# Altium project Relay-Switching-Board-v2.0.PrjPcb (part 2 of 4)
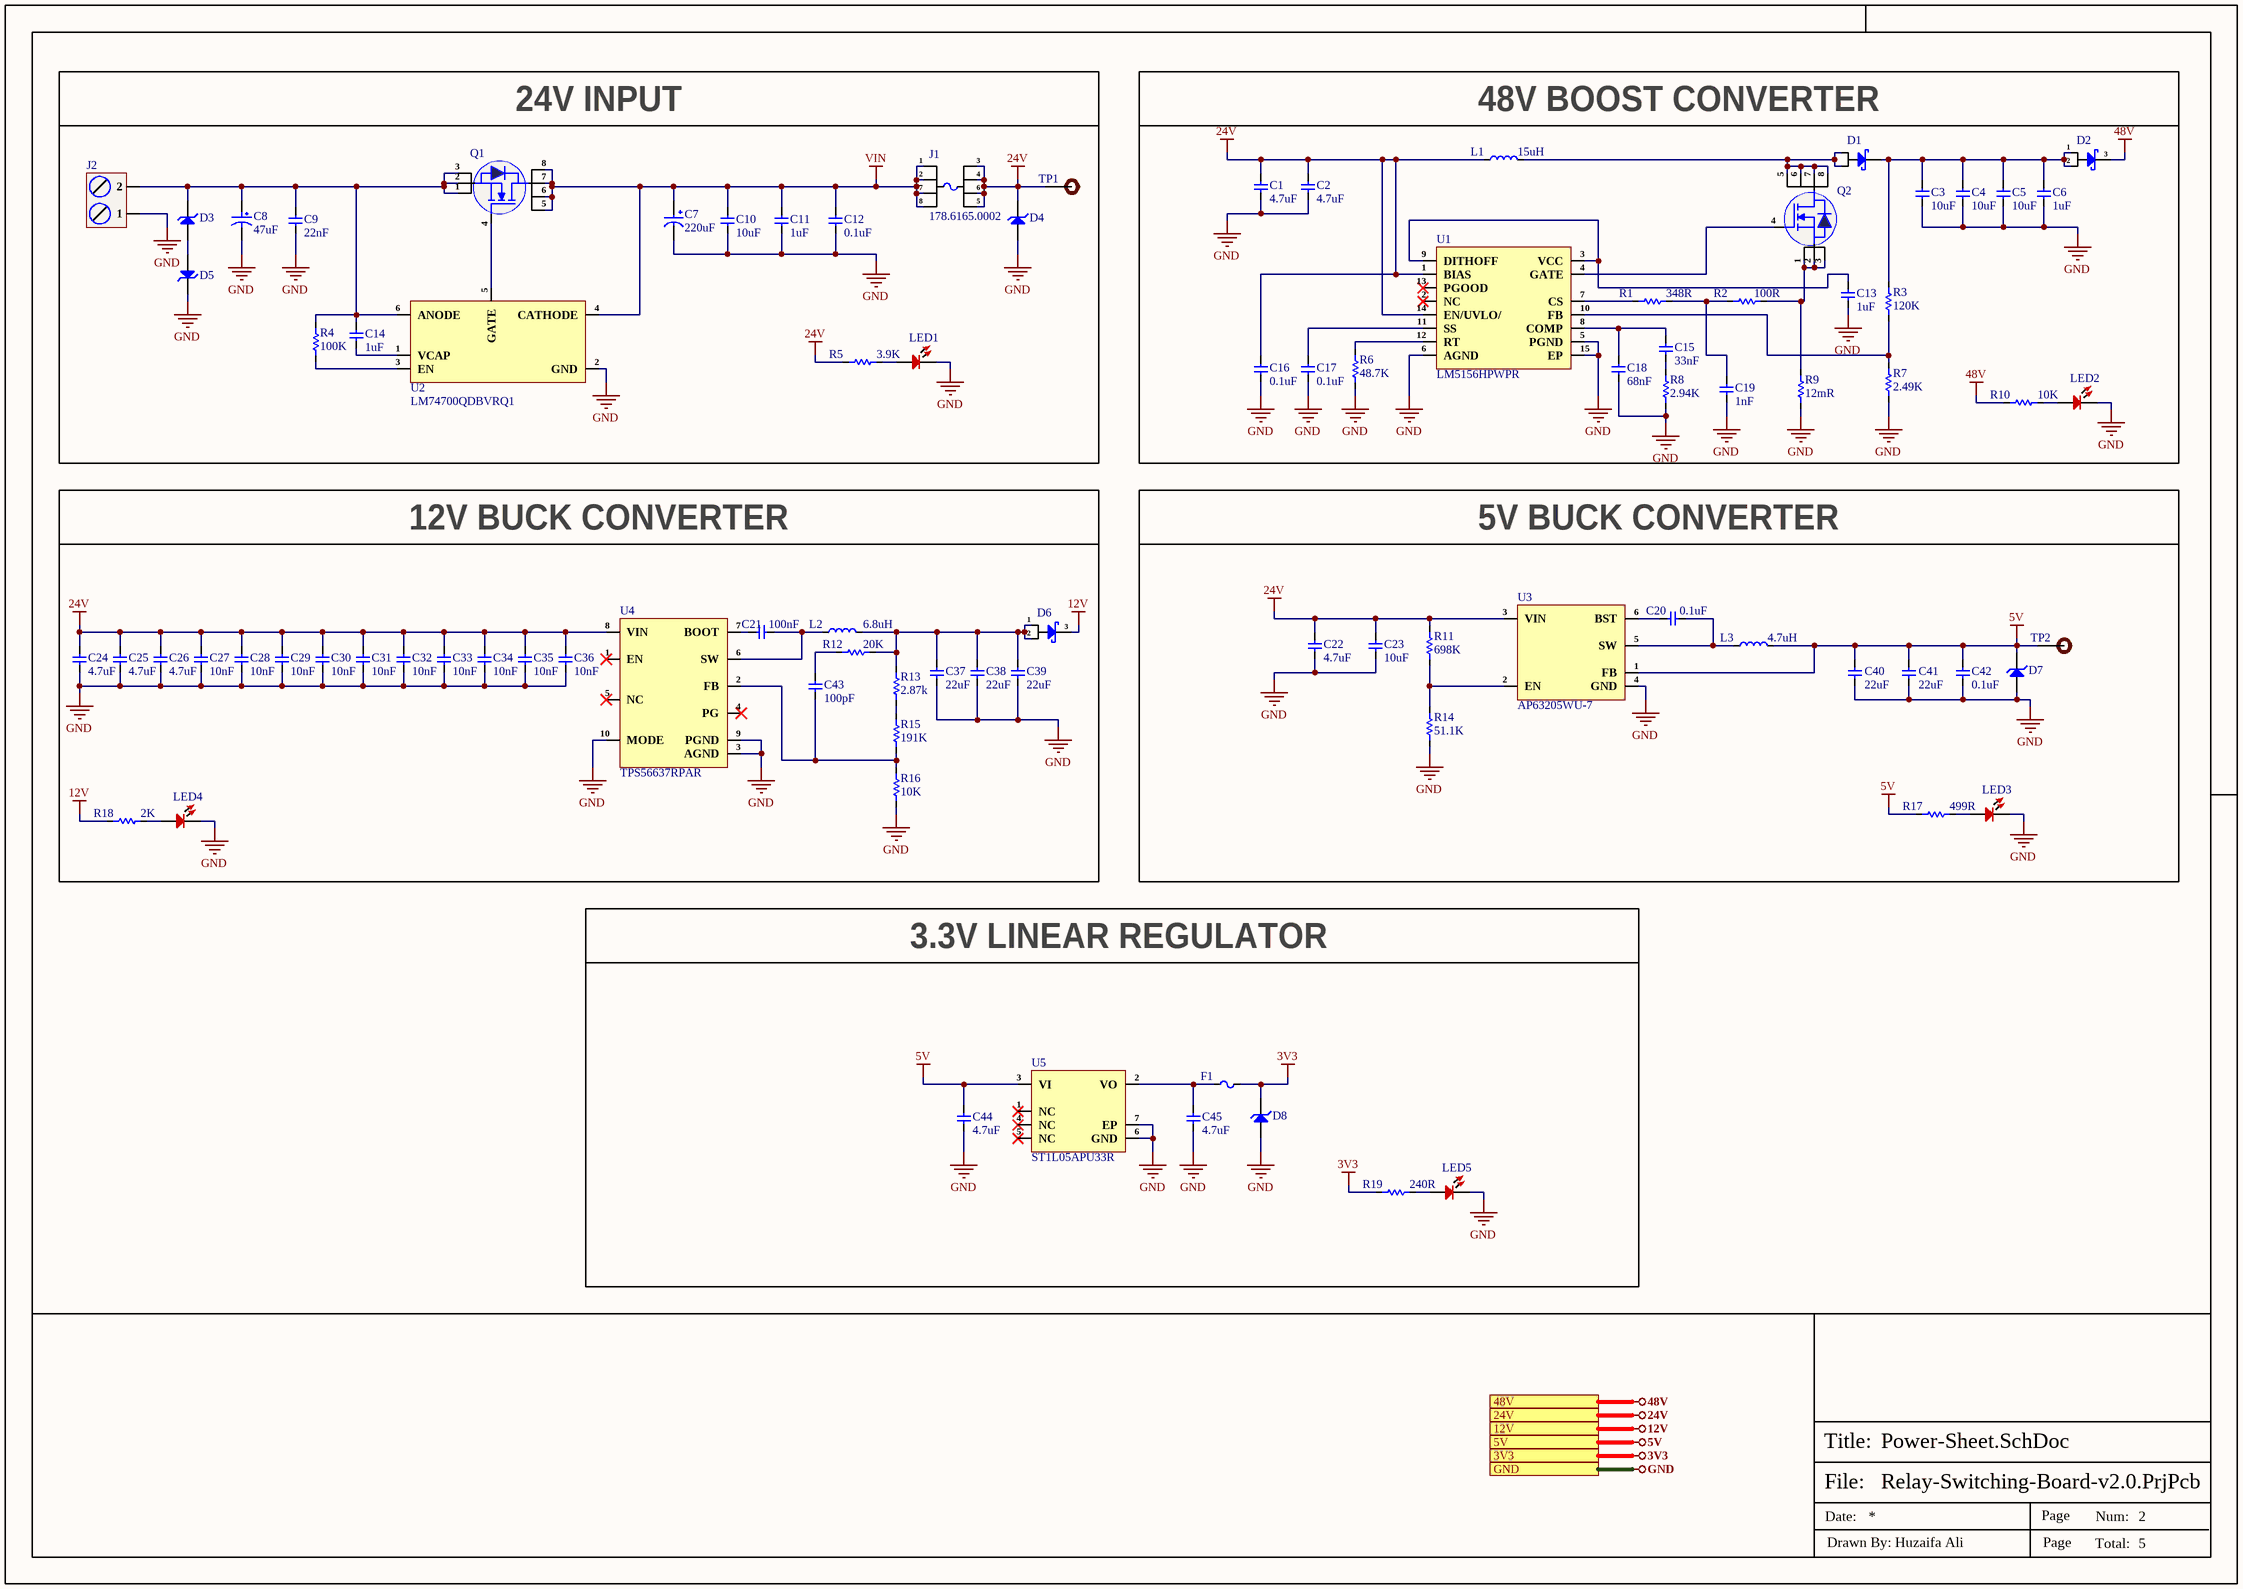
[diagram p5: Power-Sheet.SchDoc]

## Sheet Power-Sheet.SchDoc (continued)
### Library data of the parts
C1 C2 C22 C24-C26 C44 C45 = UMK316AB7475KL-T: CAP CER 4.7UF 50V X7R 1206; Manufacturer: Taiyo Yuden; Item Type: Capacitor; Tolerance: 10%; Supplier: Digikey; LCSC Part Number: C92853; Manufacturer Part Number: UMK316AB7475KL-T; RoHS: Yes; Stock: 392550; Pricing: 1=0.3, 10=0.198, 50=0.146, 100=0.1189, 500=0.09386, 1000=0.07925 (USD); Mounting Technology: Surface Mount; Case/Package: 1206; Pins: 2; Case Code (Metric): 3216; Case Code (Imperial): 1206; Min Operating Temperature: -55°C; Max Operating Temperature: 125°C; Value: 4.7uF; Voltage Rating: 50V; Packaging: Tape and Reel; Package Quantity: 2000; Voltage Rating (DC): 50V; Dielectric: X7R; Termination: SMD/SMT; Series: M; Construction: Flat; Length: 3.2mm; Width: 1.6mm; Height: 1.6mm; Depth: 1.6mm; Radiation Hardening: No; RoHS Compliant: Yes; Reach SVHC Compliant: Unknown; ComponentLink1URL: https://datasheet.ciiva.com/170/umk316ab7475kl-t-ss-170928.pdf?src-supplier=Digikey; ComponentLink1Description: https://datasheet.ciiva.com/170/umk316ab7475kl-t-ss-170928.pdf?src-supplier=Digikey; ComponentLink2URL: https://datasheet.ciiva.com/2990/umk316ab7475kl-t-ss-2990070.pdf?src-supplier=Avnet; ComponentLink2Description: https://datasheet.ciiva.com/2990/umk316ab7475kl-t-ss-2990070.pdf?src-supplier=Avnet; ComponentLink3URL: https://datasheet.ciiva.com/15922/1010umk316ab7475kl-t-15922628.pdf?src-supplier=Onlinecomponents.com; ComponentLink3Description: https://datasheet.ciiva.com/15922/1010umk316ab7475kl-t-15922628.pdf?src-supplier=Onlinecomponents.com; ComponentLink4URL: https://datasheet.ciiva.com/7975/1481447-7975911.pdf?src-supplier=Element14; ComponentLink4Description: https://datasheet.ciiva.com/7975/1481447-7975911.pdf?src-supplier=Element14; ComponentLink5URL: https://datasheet.ciiva.com/5413/mlcc-all-e-541559-5413006.pdf?src-supplier=Mouser; ComponentLink5Description: https://datasheet.ciiva.com/5413/mlcc-all-e-541559-5413006.pdf?src-supplier=Mouser
C3-C5 = FS32X106K101EGG: 100V 10uF X7R ±10% 1210 Multilayer Ceramic Capacitors MLCC - SMD/SMT ROHS; Manufacturer: PSA(Prosperity Dielectrics); Manufacturer Part Number: FS32X106K101EGG; Package: 1210; LCSC Part Number: C5156756; Item Type: Capacitor; ComponentLink1Description: LCSC; ComponentLink1URL: https://www.lcsc.com/product-detail/Multilayer-Ceramic-Capacitors-MLCC-SMD-SMT_PSA-Prosperity-Dielectrics-FS32X106K101EGG_C5156756.html
C6 = GRM31CR72A105KA01K: CAP CER 1UF 100V X7R 1206; Manufacturer: Murata; Tolerance: 10%; Supplier 1: Digi-Key; Manufacturer Part Number: GRM31CR72A105KA01K; RoHS: Yes; Category: Ceramic Capacitors; Stock 1: 11842; Pricing 1: 1=0.48000, 10=0.33000, 50=0.23100, 100=0.19800, 500=0.14850, 1000=0.12540, 2500=0.11880 (USD); Mount: Surface Mount; Case/Package: 1206; Case Code (Imperial): 1206; Case Code (Metric): 3216; Min Operating Temperature: -55°C; Max Operating Temperature: 125°C; Capacitance: 1uF; Voltage Rating: 100V; Voltage Rating (DC): 100V; Packaging: Tape and Reel; Package Quantity: 1; Dielectric: X7R; Termination: SMD/SMT; Series: GRM; Construction: Flat; Length: 3.2mm; Width: 1.6mm; Height: 1.6mm; Thickness: 0.071inch; Depth: 1.6mm; Radiation Hardening: No; RoHS Compliant: Yes; ComponentLink1URL: https://datasheet.ciiva.com/11616/product-11616604.pdf?src-supplier=Avnet; ComponentLink1Description: https://datasheet.ciiva.com/11616/product-11616604.pdf?src-supplier=Avnet; ComponentLink2URL: https://datasheet.ciiva.com/6264/partnumbering-e-01-6264397.pdf?src-supplier=Digi-Key; ComponentLink2Description: https://datasheet.ciiva.com/6264/partnumbering-e-01-6264397.pdf?src-supplier=Digi-Key; ComponentLink3URL: https://datasheet.ciiva.com/6264/partnumbering-e-01-6264398.pdf?src-supplier=Digi-Key; ComponentLink3Description: https://datasheet.ciiva.com/6264/partnumbering-e-01-6264398.pdf?src-supplier=Digi-Key; ComponentLink4URL: https://datasheet.ciiva.com/6264/partnumbering-e-01-6264399.pdf?src-supplier=Digi-Key; ComponentLink4Description: https://datasheet.ciiva.com/6264/partnumbering-e-01-6264399.pdf?src-supplier=Digi-Key; Supplier Part Number 1: 490-6523-1-ND; LCSC Part Number: C909823
C7 = UCD1H221MNL1GS: CAP ALUM 220UF 20% 50V SMD; Manufacturer: Nichicon; Ripple Current: 700mA; Impedance: 160mR; Leakage Current: 3uA; Life (Hours): 5000Hour; Dissipation Factor: 0.1%; Item Type: Capacitor; Supplier 1: Digi-Key; Manufacturer Part Number: UCD1H221MNL1GS; RoHS: Yes; Category: Aluminum Electrolytic Capacitors; Pricing 1: 1=0.85000, 10=0.60200, 50=0.45480, 100=0.39620 (USD); Mount: Surface Mount,PCB; Case/Package: Radial; Min Operating Temperature: -55°C; Max Operating Temperature: 105°C; Capacitance: 220uF; Tolerance: 20%; Voltage Rating: 50V; Packaging: Tape and Reel; Package Quantity: 1; Voltage Rating (DC): 50V; Termination: SMD/SMT; Voltage: 50V; Features: General Purpose; Series: CD; Construction: Cylindrical; Diameter: 10mm; Length: 10mm; Height: 10mm; Height - Seated (Max): 0.394inch; Radiation Hardening: No; Lead Free: Lead Free; RoHS Compliant: Yes; ComponentLink1URL: https://datasheet.ciiva.com/11776/0900766b80ebdadd-11776792.pdf?src-supplier=RSComponents; ComponentLink1Description: https://datasheet.ciiva.com/11776/0900766b80ebdadd-11776792.pdf?src-supplier=RSComponents; ComponentLink2URL: https://datasheet.ciiva.com/5362/e-cd-22158-5362489.pdf?src-supplier=Mouser; ComponentLink2Description: https://datasheet.ciiva.com/5362/e-cd-22158-5362489.pdf?src-supplier=Mouser; ComponentLink3URL: https://datasheet.ciiva.com/11684/e-cd-11684678.pdf?src-supplier=Avnet; ComponentLink3Description: https://datasheet.ciiva.com/11684/e-cd-11684678.pdf?src-supplier=Avnet; ComponentLink4URL: https://datasheet.ciiva.com/15037/e-cd-15037119.pdf?src-supplier=Digi-Key; ComponentLink4Description: https://datasheet.ciiva.com/15037/e-cd-15037119.pdf?src-supplier=Digi-Key; ComponentLink5URL: https://datasheet.ciiva.com/16393/e-cd-16393493.pdf?src-supplier=Future+Electronics; ComponentLink5Description: https://datasheet.ciiva.com/16393/e-cd-16393493.pdf?src-supplier=Future+Electronics; ComponentLink6URL: https://datasheet.ciiva.com/17354/e-cd-17354606.pdf?src-supplier=Avnet+Europe; ComponentLink6Description: https://datasheet.ciiva.com/17354/e-cd-17354606.pdf?src-supplier=Avnet+Europe; Supplier Part Number 1: 493-6390-1-ND; LCSC Part Number: C116211
C8 = RVT1H470M0607: 47uF 50V 66mA@120Hz ±20% SMD,D6.3xL7.7mm Aluminum Electrolytic Capacitors - SMD ROHS; Manufacturer: ROQANG; Manufacturer Part Number: RVT1H470M0607; Package: SMD,D6.3xL7.7mm; LCSC Part Number: C72523; Item Type: Capacitor; ComponentLink1Description: LCSC; ComponentLink1URL: https://www.lcsc.com/product-detail/Aluminum-Electrolytic-Capacitors-SMD_ROQANG-RVT1H470M0607_C72523.html
C9 = CC0805JRX7R0BB223: CAP CER 0.022UF 100V X7R 0805; Manufacturer: Yageo; Item Type: Capacitors; Tolerance: 5%; Supplier: Digikey; LCSC Part Number: C576993; Manufacturer Part Number: CC0805JRX7R0BB223; RoHS: Yes; Stock: 2257; Pricing: 1=0.13, 10=0.07, 50=0.0488, 100=0.0421, 500=0.03086, 1000=0.02736 (USD); Mounting Technology: Surface Mount; Case/Package: 0805; Min Operating Temperature: -55°C; Max Operating Temperature: 125°C; Value: 22nF; Dielectric: X7R; Construction: Flat; Length: 2mm; Height: 0.85mm; Depth: 1.25mm; RoHS Compliant: Yes; ComponentLink1URL: https://datasheet.ciiva.com/11494/upy-np0x7r-mv-100-to-630v-9-11494760.pdf?src-supplier=Avnet; ComponentLink1Description: https://datasheet.ciiva.com/11494/upy-np0x7r-mv-100-to-630v-9-11494760.pdf?src-supplier=Avnet
C10 C23 = GRM21BR61H106ME43L: CAP CER 10UF 50V X5R 0805; Manufacturer: Murata; Supplier 1: Digi-Key; Manufacturer Part Number: GRM21BR61H106ME43L; RoHS: Yes; Category: Ceramic Capacitors; Stock 1: 26; Pricing 1: 1=0.44000, 10=0.30700, 50=0.21500, 100=0.18420, 500=0.13818, 1000=0.11668 (USD); Supplier Part Number 1: 490-18664-1-ND; LCSC Part Number: C2190942
C11 C14 = CL10A105KB8NNNC: CAP CER 1UF 50V X5R 0603; Manufacturer: Samsung; Material: 4241ConductorMaterial; Tolerance: 10%; Item Type: Capacitor; Supplier: Avnet; Supplier Part Number: CL10A105KB8NNNC; Manufacturer Part Number: CL10A105KB8NNNC; RoHS: Yes; Category: Ceramic Capacitors; Stock: 780446; Pricing: 4000=0.01632, 8000=0.01595, 16000=0.01557, 24000=0.0152, 32000=0.01482 (USD); Mounting Technology: Surface Mount; Case/Package: 0603; Case Code (Metric): 1608; Case Code (Imperial): 0603; Min Operating Temperature: -55°C; Max Operating Temperature: 85°C; Packaging: Tape and Reel; Value: 1uF; Voltage Rating: 50V; Dielectric: X5R; Series: CL; Voltage Rating (DC): 50V; Length: 1.6mm; Depth: 0.8mm; Radiation Hardening: No; RoHS Compliant: Yes; ComponentLink1URL: https://datasheet.ciiva.com/26877/getdatasheetpartid-753736-26877879.pdf?src-supplier=Verical; ComponentLink1Description: https://datasheet.ciiva.com/26877/getdatasheetpartid-753736-26877879.pdf?src-supplier=Verical; LCSC Part Number: C15849
C12 C16 C20 C42 = CL10B104KB8WPNC: CAP CER 0.1UF 50V X7R 0603; Item Type: Capacitor; Material: 4241ConductorMaterial; Value: 100nF; Tolerance: 10%; LCSC Part Number: C307348; ComponentLink1Description: LCSC; Supplier: Rs; Supplier Part Number: 2575919; RoHS: Yes; Category: Ceramic Capacitors; Stock: 400; Pricing: 100=0.021, 500=0.019, 1000=0.015, 2000=0.01 (GBP); Mounting Technology: Surface Mount; Case/Package: 0603; Case Code (Metric): 1608; Case Code (Imperial): 0603; Min Operating Temperature: -55°C; Max Operating Temperature: 125°C; Packaging: Cut Tape; Voltage Rating: 50V; Series: CL; Voltage Rating (DC): 50V; Height: 900um; Ratings: AEC-Q200; RoHS Compliant: Yes; Lead Free: 5697LeadFree; ComponentLink2URL: http://www.farnell.com/datasheets/2710560.pdf?src-supplier=Farnell; ComponentLink2Description: http://www.farnell.com/datasheets/2710560.pdf?src-supplier=Farnell; ComponentLink3URL: http://www.samsungsem.com/kr/support/product-search/mlcc/CL10B104KB8WPNC.jsp?src-supplier=Digi-Key; ComponentLink3Description: http://www.samsungsem.com/kr/support/product-search/mlcc/CL10B104KB8WPNC.jsp?src-supplier=Digi-Key; ComponentLink4URL: http://www.farnell.com/datasheets/2710560.pdf?src-supplier=Element14; ComponentLink4Description: http://www.farnell.com/datasheets/2710560.pdf?src-supplier=Element14; ComponentLink5URL: https://datasheet.octopart.com/CL10B104KB8WPNC-Samsung-Electro-Mechanics-datasheet-120093645.pdf?src-supplier=Future+Electronics; ComponentLink5Description: https://datasheet.octopart.com/CL10B104KB8WPNC-Samsung-Electro-Mechanics-datasheet-120093645.pdf?src-supplier=Future+Electronics; ComponentLink6URL: http://www.farnell.com/datasheets/2710560.pdf?src-supplier=Newark; ComponentLink6Description: http://www.farnell.com/datasheets/2710560.pdf?src-supplier=Newark; ComponentLink7URL: http://www.samsungsem.com/servlet/FileDownload?type=spec&file=CL10B104KB8WPNC.pdf&src-supplier=Avnet; ComponentLink7Description: http://www.samsungsem.com/servlet/FileDownload?type=spec&file=CL10B104KB8WPNC.pdf&src-supplier=Avnet; ComponentLink8URL: https://datasheet.octopart.com/CL10B104KB8WPNC-Samsung-datasheet-8326407.pdf?src-supplier=TME; ComponentLink8Description: https://datasheet.octopart.com/CL10B104KB8WPNC-Samsung-datasheet-8326407.pdf?src-supplier=TME
C13 = CC0402KRX5R8BB105: CAP CER 1UF 25V X5R 0402; Manufacturer: Yageo; Tolerance: 10%; Supplier 1: Mouser; Manufacturer Part Number: CC0402KRX5R8BB105; RoHS: Yes; Category: Ceramic Capacitors; Stock 1: 91975; Pricing 1: 1=0.30000, 10=0.20400, 50=0.20400, 100=0.11600, 1000=0.07200, 10000=0.05900 (USD); Mount: Surface Mount; Case/Package: 0402; Case Code (Metric): 1005; Case Code (Imperial): 0402; Weight: 2.3E-05oz; Min Operating Temperature: -55°C; Max Operating Temperature: 85°C; Packaging: Tape and Reel; Capacitance: 1uF; Voltage Rating: 25V; Dielectric: X5R; Termination: SMD/SMT; Voltage Rating (DC): 25V; Package Quantity: 10000; Length: 0.039inch; Width: 0.02inch; Thickness: 0.022inch; Lead Free: Lead Free; Halogen Free: Halogen Free; RoHS Compliant: Yes; ComponentLink1URL: http://www.mouser.com/ds/2/447/Yageo_UPY-GP_NP0_16V-to-50V_9-358835.pdf?src-supplier=Mouser; ComponentLink1Description: http://www.mouser.com/ds/2/447/Yageo_UPY-GP_NP0_16V-to-50V_9-358835.pdf?src-supplier=Mouser; ComponentLink2URL: http://www.yageo.com/documents/recent/UPY-GPHC_X5R_4V-to-50V_25.pdf?src-supplier=Digi-Key; ComponentLink2Description: http://www.yageo.com/documents/recent/UPY-GPHC_X5R_4V-to-50V_25.pdf?src-supplier=Digi-Key; ComponentLink3URL: https://4donline.ihs.com/images/VipMasterIC/IC/YAGO/YAGO-S-A0006851646/YAGO-S-A0006851646-1.pdf?hkey=6D3A4C79FDBF58556ACFDE234799DDF0&src-supplier=Newark; ComponentLink3Description: https://4donline.ihs.com/images/VipMasterIC/IC/YAGO/YAGO-S-A0006851646/YAGO-S-A0006851646-1.pdf?hkey=6D3A4C79FDBF58556ACFDE234799DDF0&src-supplier=Newark; Supplier Part Number 1: 603-CC402KRX5R8BB105; LCSC Part Number: C326568
C15 = CC0402KRX7R8BB333: CAP CER 0.033UF 25V X7R 0402; Manufacturer: Yageo; Item Type: Capacitor; Material: 4241ConductorMaterial; Tolerance: 10%; Temperature Coefficient: 30ppm/°C; Supplier: Future Electronics; Supplier Part Number: 4094394; Manufacturer Part Number: CC0402KRX7R8BB333; RoHS: Yes; Stock: 50000; Pricing: 10000=0.004, 40000=0.0038, 150000=0.0036, 250000=0.0035, 500000=0.0033 (USD); Mounting Technology: Surface Mount; Case/Package: 0402; Case Code (Imperial): 0402; Case Code (Metric): 1005; Weight: 2.3E-05oz; Min Operating Temperature: -55°C; Max Operating Temperature: 125°C; Value: 33nF; Dielectric: X7R; Packaging: Tape and Reel; Voltage Rating (DC): 25V; Voltage Rating: 25V; Termination: SMD/SMT; Series: CC; Length: 0.039inch; Width: 0.02inch; Thickness: 0.022inch; Lead Free: Lead Free; Halogen Free: Halogen Free; RoHS Compliant: Yes; ComponentLink1URL: https://datasheet.ciiva.com/13264/upy-gphc-x7r-6-3v-to-50v-8-12304-13264253.pdf?src-supplier=Mouser; ComponentLink1Description: https://datasheet.ciiva.com/13264/upy-gphc-x7r-6-3v-to-50v-8-12304-13264253.pdf?src-supplier=Mouser; LCSC Part Number: C326974
C17 = CL05B104KB54PNC: CAP CER 0.1UF 50V X7R 0402; Manufacturer: Samsung; Item Type: Capacitor; LCSC Part Number: C307331; Supplier 1: Digi-Key; Manufacturer Part Number: CL05B104KB54PNC; Stock 1: 8594; Pricing 1: 1=0.1, 10=0.067, 50=0.0366, 100=0.0299, 500=0.02138, 1000=0.01681, 2500=0.01528, 5000=0.01406 (USD); Supplier Part Number 1: 1276-CL05B104KB54PNCDKR-ND
C18 = CC0402KRX7R9BB683: CAP CER 0.068UF 50V X7R 0402; Manufacturer: Yageo; Dielectric: 1511DielectricType; Item Type: Capacitor; Supplier 1: Future Electronics; Manufacturer Part Number: CC0402KRX7R9BB683; RoHS: Yes; Category: Ceramic Capacitors; Stock 1: 100000; Pricing 1: 10000=0.0035, 40000=0.0033, 100000=0.0032, 250000=0.0031, 400000=0.0029 (USD); Case/Package: 343Case; Capacitance: 68nF; Voltage Rating (DC): 50V; Halogen Free: 5694HalogenFree; Lead Free: 5697LeadFree; Supplier Part Number 1: 2106471
C19 = CC0402KRX7R9BB102: CAP CER 1000PF 50V X7R 0402; Manufacturer: Yageo; Item Type: Capacitors; Material: 4241ConductorMaterial; Tolerance: 10%; Temperature Coefficient: 30ppm/°C; Insulation Resistance: 100GR; Supplier: Rs; LCSC Part Number: C106205; Manufacturer Part Number: CC0402KRX7R9BB102; RoHS: Yes; Stock: 16500; Mounting Technology: Surface Mount; Case/Package: 0402; Case Code (Metric): 1005; Case Code (Imperial): 0402; Dielectric Material: 4241ConductorMaterial; Min Operating Temperature: -55°C; Max Operating Temperature: 125°C; Value: 1nF; Voltage Rating: 50V; Packaging: Cut Tape; Series: CC; Voltage Rating (AC): 50V; Length: 0.039inch; Width: 0.02inch; Thickness: 0.022inch; RoHS Compliant: Yes; Lead Free: 5697LeadFree; Halogen Free: 5694HalogenFree; ComponentLink1URL: https://datasheet.ciiva.com/11786/0900766b8079c870-11786157.pdf?src-supplier=Rs; ComponentLink1Description: https://datasheet.ciiva.com/11786/0900766b8079c870-11786157.pdf?src-supplier=Rs; ComponentLink2URL: https://datasheet.ciiva.com/7978/1489800-7978092.pdf?src-supplier=Element14; ComponentLink2Description: https://datasheet.ciiva.com/7978/1489800-7978092.pdf?src-supplier=Element14; ComponentLink3URL: https://datasheet.ciiva.com/22749/1489800-22749213.pdf?src-supplier=Element14; ComponentLink3Description: https://datasheet.ciiva.com/22749/1489800-22749213.pdf?src-supplier=Element14; ComponentLink4URL: https://datasheet.ciiva.com/143/mlccorderingcode-143957.pdf?src-supplier=Digikey; ComponentLink4Description: https://datasheet.ciiva.com/143/mlccorderingcode-143957.pdf?src-supplier=Digikey; ComponentLink5URL: https://datasheet.ciiva.com/143/mlccorderingcode-143956.pdf?src-supplier=Digikey; ComponentLink5Description: https://datasheet.ciiva.com/143/mlccorderingcode-143956.pdf?src-supplier=Digikey; ComponentLink6URL: https://datasheet.ciiva.com/143/mlccorderingcode-143958.pdf?src-supplier=Digikey; ComponentLink6Description: https://datasheet.ciiva.com/143/mlccorderingcode-143958.pdf?src-supplier=Digikey; ComponentLink7URL: https://datasheet.ciiva.com/13389/upy-gp-np0-16v-to-50v-8-13389974.pdf?src-supplier=Mouser; ComponentLink7Description: https://datasheet.ciiva.com/13389/upy-gp-np0-16v-to-50v-8-13389974.pdf?src-supplier=Mouser; ComponentLink8URL: https://datasheet.ciiva.com/15189/getdatasheetpartid-403474-15189131.pdf?src-supplier=Verical; ComponentLink8Description: https://datasheet.ciiva.com/15189/getdatasheetpartid-403474-15189131.pdf?src-supplier=Verical
C21 = CC0603KRX5R9BB104: CAP CER 0.1UF 50V X5R 0603; Manufacturer: Yageo; Tolerance: 10%; Item Type: Capacitor; Supplier 1: Digi-Key; Manufacturer Part Number: CC0603KRX5R9BB104; RoHS: Yes; Category: Ceramic Capacitors; Stock 1: 152253; Pricing 1: 1=0.10000, 10=0.05200, 50=0.02820, 100=0.02310, 500=0.01648, 1000=0.01294 (USD); Mount: Surface Mount; Case/Package: 0603; Case Code (Imperial): 0603; Case Code (Metric): 1608; Weight: 7.1E-05oz; Min Operating Temperature: -55°C; Max Operating Temperature: 85°C; Capacitance: 100nF; Packaging: Tape and Reel; Voltage Rating: 50V; Dielectric: X5R; Termination: SMD/SMT; Voltage Rating (DC): 50V; Package Quantity: 4000; Length: 0.063inch; Width: 0.031inch; Thickness: 0.035inch; Lead Free: Lead Free; Halogen Free: Halogen Free; ComponentLink1URL: http://www.mouser.com/ds/2/447/Yageo_UPY-GP_NP0_16V-to-50V_9-358835.pdf?src-supplier=Mouser; ComponentLink1Description: http://www.mouser.com/ds/2/447/Yageo_UPY-GP_NP0_16V-to-50V_9-358835.pdf?src-supplier=Mouser; ComponentLink2URL: https://www.yageo.com/upload/media/product/productsearch/datasheet/mlcc/UPY-GPHC_X5R_4V-to-50V_26.pdf?src-supplier=Digi-Key; ComponentLink2Description: https://www.yageo.com/upload/media/product/productsearch/datasheet/mlcc/UPY-GPHC_X5R_4V-to-50V_26.pdf?src-supplier=Digi-Key; ComponentLink3URL: http://www.yageo.com/exep/pages/download/literatures/ProductSelectionGuide%202014_Final_2.pdf?src-supplier=Digi-Key; ComponentLink3Description: http://www.yageo.com/exep/pages/download/literatures/ProductSelectionGuide%202014_Final_2.pdf?src-supplier=Digi-Key; Supplier Part Number 1: 311-4046-1-ND; LCSC Part Number: C110022
C27-C36 = CC0402KRX7R9BB103: CAP CER 10000PF 50V X7R 0402; Manufacturer: Yageo; Tolerance: 10%; Item Type: Capacitor; Supplier 1: Avnet; Manufacturer Part Number: CC0402KRX7R9BB103; RoHS: Yes; Category: Ceramic Capacitors; Stock 1: 995000; Pricing 1: 10000=0.00178 (USD); Mount: Surface Mount; Case/Package: 0402; Case Code (Imperial): 0402; Case Code (Metric): 1005; Min Operating Temperature: -55°C; Max Operating Temperature: 125°C; Capacitance: 10nF; Dielectric: X7R; Packaging: Tape and Reel; Voltage Rating: 50V; Voltage Rating (DC): 50V; Package Quantity: 1; Termination: SMD/SMT; Resistor Type: Ceramic; Voltage: 50V; Series: CC; Length: 1mm; Width: 0.02inch; Height: 0.5mm; Thickness: 0.022inch; Depth: 0.5mm; Radiation Hardening: No; RoHS Compliant: Yes; Reach SVHC Compliant: Yes; Lead Free: Lead Free; Halogen Free: Halogen Free; ComponentLink1URL: https://datasheet.ciiva.com/11788/0900766b8079c870-11788375.pdf?src-supplier=RSComponents; ComponentLink1Description: https://datasheet.ciiva.com/11788/0900766b8079c870-11788375.pdf?src-supplier=RSComponents; ComponentLink2URL: https://datasheet.ciiva.com/26862/getdatasheetpartid-138248-26862642.pdf?src-supplier=Verical; ComponentLink2Description: https://datasheet.ciiva.com/26862/getdatasheetpartid-138248-26862642.pdf?src-supplier=Verical; ComponentLink3URL: https://datasheet.ciiva.com/7978/1489800-7978093.pdf?src-supplier=Element14; ComponentLink3Description: https://datasheet.ciiva.com/7978/1489800-7978093.pdf?src-supplier=Element14; ComponentLink4URL: https://datasheet.ciiva.com/28450/1489800-28450377.pdf?src-supplier=Element14; ComponentLink4Description: https://datasheet.ciiva.com/28450/1489800-28450377.pdf?src-supplier=Element14; ComponentLink5URL: https://datasheet.ciiva.com/176/mlccorderingcode-176349.pdf?src-supplier=Digi-Key; ComponentLink5Description: https://datasheet.ciiva.com/176/mlccorderingcode-176349.pdf?src-supplier=Digi-Key; ComponentLink6URL: https://datasheet.ciiva.com/176/mlccorderingcode-176348.pdf?src-supplier=Digi-Key; ComponentLink6Description: https://datasheet.ciiva.com/176/mlccorderingcode-176348.pdf?src-supplier=Digi-Key; ComponentLink7URL: https://datasheet.ciiva.com/176/mlccorderingcode-176350.pdf?src-supplier=Digi-Key; ComponentLink7Description: https://datasheet.ciiva.com/176/mlccorderingcode-176350.pdf?src-supplier=Digi-Key; Supplier Part Number 1: CC0402KRX7R9BB103; LCSC Part Number: C60133
C37-C39 = GRM32ER71E226KE15L: CAP CER 22UF 25V X7R 1210; Manufacturer: Murata; Item Type: Capacitors; Color: 46Colour; Current Rating: 3A; Gender: 29Gender; Supplier: Mouser; LCSC Part Number: C21397; Manufacturer Part Number: GRM32ER71E226KE15L; RoHS: Yes; Stock: 50822; Pricing: 1=0.78, 10=0.39, 50=0.39, 100=0.351, 1000=0.297, 10000=0.267 (USD); Contact Material: 150ConductorMaterial; Contact Plating: 157ConductorMaterial; Lead Pitch: 2.54mm; Lead Free: 5697LeadFree; ComponentLink1URL: https://datasheet.ciiva.com/16497/product-16497009.pdf?src-supplier=Future+Electronics; ComponentLink1Description: https://datasheet.ciiva.com/16497/product-16497009.pdf?src-supplier=Future+Electronics; ComponentLink2URL: https://datasheet.ciiva.com/6072/1697714-6072768.pdf?src-supplier=Farnell; ComponentLink2Description: https://datasheet.ciiva.com/6072/1697714-6072768.pdf?src-supplier=Farnell; ComponentLink3URL: https://datasheet.ciiva.com/3776/2741grm32er71e226ke1523-3776996.pdf?src-supplier=Arrow+Electronics; ComponentLink3Description: https://datasheet.ciiva.com/3776/2741grm32er71e226ke1523-3776996.pdf?src-supplier=Arrow+Electronics; ComponentLink4URL: https://datasheet.ciiva.com/11789/0900766b80ef921d-11789129.pdf?src-supplier=Rs; ComponentLink4Description: https://datasheet.ciiva.com/11789/0900766b80ef921d-11789129.pdf?src-supplier=Rs; ComponentLink5URL: https://datasheet.ciiva.com/29201/451826-da-01-de-vs-kondens-grm32-er71e-226ke15l-29201795.pdf?src-supplier=Conrad; ComponentLink5Description: https://datasheet.ciiva.com/29201/451826-da-01-de-vs-kondens-grm32-er71e-226ke15l-29201795.pdf?src-supplier=Conrad; ComponentLink6URL: https://datasheet.ciiva.com/22703/1697714-22703397.pdf?src-supplier=Element14; ComponentLink6Description: https://datasheet.ciiva.com/22703/1697714-22703397.pdf?src-supplier=Element14; ComponentLink7URL: https://datasheet.ciiva.com/175/partnumbering-e-01-175746.pdf?src-supplier=Digikey; ComponentLink7Description: https://datasheet.ciiva.com/175/partnumbering-e-01-175746.pdf?src-supplier=Digikey; ComponentLink8URL: https://datasheet.ciiva.com/175/partnumbering-e-01-175747.pdf?src-supplier=Digikey; ComponentLink8Description: https://datasheet.ciiva.com/175/partnumbering-e-01-175747.pdf?src-supplier=Digikey; ComponentLink9URL: https://datasheet.ciiva.com/175/partnumbering-e-01-175748.pdf?src-supplier=Digikey; ComponentLink9Description: https://datasheet.ciiva.com/175/partnumbering-e-01-175748.pdf?src-supplier=Digikey
C40 C41 = GRM21BZ71A226ME15L: CAP CER 22UF 10V X7R 0805; Manufacturer: Murata; Item Type: Capacitor; Material: 4241ConductorMaterial; Tolerance: 20%; Supplier: Digi-Key; LCSC Part Number: C907991; Manufacturer Part Number: GRM21BZ71A226ME15L; RoHS: Yes; Stock: 49126; Pricing: 1=0.39, 10=0.259, 50=0.191, 100=0.1556, 500=0.12282, 1000=0.10372 (USD); ComponentLink1URL: https://datasheet.octopart.com/GRM21BZ71A226ME15L-Murata-datasheet-165579666.pdf?src-supplier=TME; ComponentLink1Description: https://datasheet.octopart.com/GRM21BZ71A226ME15L-Murata-datasheet-165579666.pdf?src-supplier=TME; ComponentLink2URL: https://www.lcsc.com/product-detail/Multilayer-Ceramic-Capacitors-MLCC-SMD-SMT_Murata-Electronics-GRM21BZ71A226ME15L_C907991.html; ComponentLink2Description: LCSC; Supplier Part Number: 490-GRM21BZ71A226ME15LCT-ND; Category: Ceramic Capacitors; Package: 0805; Min Operating Temperature: -55°C; Max Operating Temperature: 125°C; Value: 22uF; Voltage Rating: 10V; Length: 2mm; Width: 1.25mm; Height: 1.45mm; Thickness: 1.25mm
C43 = CC0402JRNPO9BN101: CAP CER 100PF 50V C0G/NPO 0402; Manufacturer: Yageo; Dielectric Material: Ceramic; Tolerance: 5%; Dielectric: C0G; Temperature Coefficient: 30ppm/°C; Insulation Resistance: 100GR; Item Type: Capacitor; Supplier: Future Electronics; Supplier Part Number: 8934564; Manufacturer Part Number: CC0402JRNPO9BN101; RoHS: Yes; Category: Ceramic Capacitors; Stock: 11720000; Pricing: 10000=0.002, 40000=0.0019, 150000=0.0018, 400000=0.0018, 1000000=0.0017 (USD); Mounting Technology: Surface Mount; Case/Package: 0402; Pins: 2; Case Code (Imperial): 0402; Case Code (Metric): 1005; Min Operating Temperature: -55°C; Max Operating Temperature: 125°C; Value: 100pF; Voltage Rating: 50V; Voltage Rating (DC): 50V; Packaging: Tape and Reel; Package Quantity: 1; Termination: SMD/SMT; Voltage: 50V; Series: CC; Length: 1mm; Width: 0.02inch; Height: 0.5mm; Thickness: 0.022inch; Depth: 0.5mm; Radiation Hardening: No; RoHS Compliant: Yes; Reach SVHC Compliant: No; Lead Free: Lead Free; ComponentLink1URL: https://datasheet.ciiva.com/11786/0900766b80d84fbf-11786101.pdf?src-supplier=Rs; ComponentLink1Description: https://datasheet.ciiva.com/11786/0900766b80d84fbf-11786101.pdf?src-supplier=Rs; ComponentLink2URL: https://datasheet.ciiva.com/23767/25787-23767888.pdf?src-supplier=Newark; ComponentLink2Description: https://datasheet.ciiva.com/23767/25787-23767888.pdf?src-supplier=Newark; ComponentLink3URL: https://datasheet.ciiva.com/28450/1443161-28450220.pdf?src-supplier=Element14; ComponentLink3Description: https://datasheet.ciiva.com/28450/1443161-28450220.pdf?src-supplier=Element14; ComponentLink4URL: https://datasheet.ciiva.com/8033/1443161-8033598.pdf?src-supplier=Element14; ComponentLink4Description: https://datasheet.ciiva.com/8033/1443161-8033598.pdf?src-supplier=Element14; ComponentLink5URL: https://datasheet.ciiva.com/143/mlccorderingcode-143990.pdf?src-supplier=Digi-Key; ComponentLink5Description: https://datasheet.ciiva.com/143/mlccorderingcode-143990.pdf?src-supplier=Digi-Key; ComponentLink6URL: https://datasheet.ciiva.com/143/mlccorderingcode-143989.pdf?src-supplier=Digi-Key; ComponentLink6Description: https://datasheet.ciiva.com/143/mlccorderingcode-143989.pdf?src-supplier=Digi-Key; ComponentLink7URL: https://datasheet.ciiva.com/143/mlccorderingcode-143991.pdf?src-supplier=Digi-Key; ComponentLink7Description: https://datasheet.ciiva.com/143/mlccorderingcode-143991.pdf?src-supplier=Digi-Key; LCSC Part Number: C106200
D1 = STPS20M100SG-TR: DIODE SCHOTTKY 100V 20A D2PAK; Manufacturer: STMicroelectronics; Supplier: Mouser; Supplier Part Number: 511-STPS20M100SG-TR; Manufacturer Part Number: STPS20M100SG-TR; RoHS: Yes; Category: Rectifier Diodes; Stock: 6295; Pricing: 1=2.95, 10=2.48, 50=2.48, 100=2.01, 1000=1.53, 10000=1.38 (USD); ComponentLink1URL: https://datasheet.ciiva.com/16356/cd00228904-16356744.pdf?src-supplier=Future+Electronics; ComponentLink1Description: https://datasheet.ciiva.com/16356/cd00228904-16356744.pdf?src-supplier=Future+Electronics; ComponentLink2URL: https://datasheet.ciiva.com/917/cd00228904-917526.pdf?src-supplier=Digikey; ComponentLink2Description: https://datasheet.ciiva.com/917/cd00228904-917526.pdf?src-supplier=Digikey; ComponentLink3URL: https://datasheet.ciiva.com/917/cd00228904-917527.pdf?src-supplier=Digikey; ComponentLink3Description: https://datasheet.ciiva.com/917/cd00228904-917527.pdf?src-supplier=Digikey; LCSC Part Number: C969989; Item Type: Diode
D2 D6 = V25PN60-M3/86A: DIODE SCHOTTKY 60V 6.4A TO277A; Manufacturer: Vishay Semiconductors; Supplier: Mouser; LCSC Part Number: 78-V25PN60-M386A; Manufacturer Part Number: V25PN60-M3/86A; RoHS: Yes; Item Type: Diode; Stock: 10628; Pricing: 1=1, 10=0.82, 50=0.82, 100=0.638, 1000=0.436, 10000=0.43 (USD); ComponentLink1URL: http://www.farnell.com/datasheets/2614078.pdf?src-supplier=Farnell; ComponentLink1Description: http://www.farnell.com/datasheets/2614078.pdf?src-supplier=Farnell; ComponentLink2URL: http://www.vishay.com/docs/87718/v25pn60.pdf?src-supplier=Digikey; ComponentLink2Description: http://www.vishay.com/docs/87718/v25pn60.pdf?src-supplier=Digikey; ComponentLink3URL: https://www.vishay.com/docs/87718/v25pn60.pdf?src-supplier=Digikey; ComponentLink3Description: https://www.vishay.com/docs/87718/v25pn60.pdf?src-supplier=Digikey
D3 = SMBJ58A-13-F: TVS DIODE 58VWM 93.6VC SMB; Manufacturer: Diodes; Supplier: Future Electronics; LCSC Part Number: C135085; Manufacturer Part Number: SMBJ58A-13-F; RoHS: Yes; Item Type: Diode; Stock: 6000; Pricing: 3000=0.0711, 9000=0.0684, 15000=0.0671, 30000=0.0655, 60000=0.063 (USD); ComponentLink1URL: https://datasheet.ciiva.com/25624/0900766b8104bed2-25624843.pdf?src-supplier=Rs; ComponentLink1Description: https://datasheet.ciiva.com/25624/0900766b8104bed2-25624843.pdf?src-supplier=Rs; ComponentLink2URL: https://datasheet.ciiva.com/15143/getdatasheetpartid-39642-15143045.pdf?src-supplier=Verical; ComponentLink2Description: https://datasheet.ciiva.com/15143/getdatasheetpartid-39642-15143045.pdf?src-supplier=Verical; ComponentLink3URL: https://datasheet.ciiva.com/4520/ds19002-4520617.pdf?src-supplier=Mouser; ComponentLink3Description: https://datasheet.ciiva.com/4520/ds19002-4520617.pdf?src-supplier=Mouser; ComponentLink4URL: https://datasheet.ciiva.com/16393/ds19002-16393005.pdf?src-supplier=Future+Electronics; ComponentLink4Description: https://datasheet.ciiva.com/16393/ds19002-16393005.pdf?src-supplier=Future+Electronics
D4 = AZ4024-01G: 26.7V 24V SOD-123 ESD and Surge Protection (TVS/ESD) ROHS; Manufacturer: AMAZING; Manufacturer Part Number: AZ4024-01G; Package: SOD-123; LCSC Part Number: C5571859; Item Type: (TVS/ESD); ComponentLink1Description: LCSC; ComponentLink1URL: https://www.lcsc.com/product-detail/ESD-and-Surge-Protection-TVS-ESD_AMAZING-AZ4024-01G_C5571859.html
D5 = SMBJ26A-13-F: TVS DIODE 26VWM 42.1VC SMB; Manufacturer: Diodes; Item Type: TVS Diodes; Supplier: Future Electronics; Supplier Part Number: 3363900; Manufacturer Part Number: SMBJ26A-13-F; RoHS: Yes; Stock: 9000; Pricing: 3000=0.0717, 9000=0.069, 15000=0.0677, 30000=0.0661, 60000=0.0635 (USD); ComponentLink1URL: https://datasheet.ciiva.com/15143/getdatasheetpartid-118169-15143570.pdf?src-supplier=Verical; ComponentLink1Description: https://datasheet.ciiva.com/15143/getdatasheetpartid-118169-15143570.pdf?src-supplier=Verical; ComponentLink2URL: https://datasheet.ciiva.com/16211/ds19002-16211003.pdf?src-supplier=Future+Electronics; ComponentLink2Description: https://datasheet.ciiva.com/16211/ds19002-16211003.pdf?src-supplier=Future+Electronics; LCSC Part Number: C135062
D7 = AZ3005-01G: 6V 5V SOD-123 ESD and Surge Protection (TVS/ESD) ROHS; Manufacturer: AMAZING; Manufacturer Part Number: AZ3005-01G; Package: SOD-123; LCSC Part Number: C7079241; Item Type: (TVS/ESD); ComponentLink1Description: LCSC; ComponentLink1URL: https://www.lcsc.com/product-detail/ESD-and-Surge-Protection-TVS-ESD_AMAZING-AZ3005-01G_C7079241.html
D8 = AZ3003-01G: TVS SURGE PROTECTOR 1-CH 3.3V; Manufacturer: Amazing; Item Type: Diode; Manufacturer Part Number: AZ3003-01G; Package: SOD-123; LCSC Part Number: -; ComponentLink1Description: Digikey; ComponentLink1URL: https://www.digikey.com/en/products/detail/amazing/AZ3003-01G/16615352?s=N4IgTCBcDaIIIC0DMAGFSC0KCMBxEAugL5A
F1 = 0805L110SLYR: PTC RESET FUSE 6V 1.1A 0805; Manufacturer: Littelfuse; Item Type: Fuses; Supplier: Digikey; LCSC Part Number: C207024; Manufacturer Part Number: 0805L110SLYR; RoHS: Yes; Stock: 3032; Pricing: 1=1.74, 5=1.448, 10=1.339, 50=1.1156, 100=1.0309, 250=0.92832, 500=0.85714, 1000=0.79108 (USD); ComponentLink1URL: https://datasheet.ciiva.com/326/littelfuse-resettable-ptcs-lorho-datasheet-326160.pdf?src-supplier=Digikey; ComponentLink1Description: https://datasheet.ciiva.com/326/littelfuse-resettable-ptcs-lorho-datasheet-326160.pdf?src-supplier=Digikey; ComponentLink2URL: https://datasheet.ciiva.com/28410/949281-28410775.pdf?src-supplier=Element14; ComponentLink2Description: https://datasheet.ciiva.com/28410/949281-28410775.pdf?src-supplier=Element14
J1 = 178.6165.0002: FUSE HOLDER BLADE 80V PCB; Manufacturer: Littelfuse Wickmann; Body Material: 4896ConductorMaterial; Current Rating: 30A; Supplier: Future Electronics; Supplier Part Number: 9883406; Manufacturer Part Number: 178.6165.0002; RoHS: Yes; Category: Fuse Holders; Stock: 3811; Pricing: 1=2.02, 40=1.96, 125=1.91, 400=1.86, 1250=1.77 (USD); Material: 4896ConductorMaterial; Width: 17.5mm; Thickness: 6mm; Lead Free: 5697LeadFree; ComponentLink1URL: https://datasheet.ciiva.com/295/littelfuse-ato-pcb-fuse-holders-178-6765-295568.pdf?src-supplier=Digikey; ComponentLink1Description: https://datasheet.ciiva.com/295/littelfuse-ato-pcb-fuse-holders-178-6765-295568.pdf?src-supplier=Digikey; ComponentLink2URL: https://datasheet.ciiva.com/4480/flrholder-58019-4480354.pdf?src-supplier=Mouser; ComponentLink2Description: https://datasheet.ciiva.com/4480/flrholder-58019-4480354.pdf?src-supplier=Mouser; ComponentLink3URL: https://datasheet.ciiva.com/16372/flrholder-16372408.pdf?src-supplier=Future+Electronics; ComponentLink3Description: https://datasheet.ciiva.com/16372/flrholder-16372408.pdf?src-supplier=Future+Electronics; ComponentLink4URL: https://datasheet.ciiva.com/15187/getdatasheetpartid-31610-15187861.pdf?src-supplier=Verical; ComponentLink4Description: https://datasheet.ciiva.com/15187/getdatasheetpartid-31610-15187861.pdf?src-supplier=Verical; LCSC Part Number: C207061; Item Type: Fuse Holder
J2 = DB128L-5.08-2P-OG-S: 1x2P 18A -40℃~+105℃ 250V Orange 12~30 Straight 5.08mm 2.5 1 2 Plugin,P=5.08mm Screw terminal ROHS; Manufacturer: DORABO; Item Type: Terminal Block; Manufacturer Part Number: DB128L-5.08-2P-OG-S; Package: Plugin,P=5.08mm; LCSC Part Number: C430603; ComponentLink1Description: LCSC; ComponentLink1URL: https://www.lcsc.com/product-detail/Screw-terminal_DORABO-DB128L-5-08-2P-OG-S_C430603.html
L1 = FEXL1010A-150M: 13.8A 15uH Integrated molded inductor ±20% 15.5A SMD,11.9x11mm Power Inductors ROHS; Manufacturer: cjiang; Manufacturer Part Number: FEXL1010A-150M; Package: SMD,11.9x11mm; LCSC Part Number: C5378579; Item Type: Inductor; ComponentLink1Description: LCSC; ComponentLink1URL: https://www.lcsc.com/product-detail/Power-Inductors_cjiang-Changjiang-Microelectronics-Tech-FEXL1010A-150M_C5378579.html
L2 = MWSA1206S-6R8MT: Fixed Ind 6.8UH 12A 13.5MOHM SMD; Manufacturer: Sunlord; Item Type: Inductor; Supplier: Digikey; LCSC Part Number: C408523; Manufacturer Part Number: MWSA1206S-6R8MT; RoHS: No; Stock: 495; Pricing: 1=1.68, 10=1.302, 25=1.1772, 50=1.0908, 100=1.0103, 250=0.91272 (USD)
L3 = YPRH0703-4R7M: 2.26A 4.7uH ±20% SMD,7.3x7.3mm Power Inductors ROHS; Manufacturer: YJYCOIN; Manufacturer Part Number: YPRH0703-4R7M; Package: SMD,7.3x7.3mm; LCSC Part Number: C338836; Item type: Inductor; ComponentLink1Description: LCSC; ComponentLink1URL: https://www.lcsc.com/product-detail/Power-Inductors_YJYCOIN-YPRH0703-4R7M_C338836.html
LED1-LED5 = NCD0603R3: RED LED 0603 Light Emitting Diodes; Manufacturer: Foshan NationStar Optoelectronics; Manufacturer Part Number: NCD0603R3; Package: 0603; Item Type: LED; LCSC Part Number: C3151730; ComponentLink1Description: LCSC; ComponentLink1URL: https://www.lcsc.com/product-detail/Light-Emitting-Diodes-LED_Foshan-NationStar-Optoelectronics-NCD0603R3_C3151730.html
Q1 = CSD18531Q5A: MOSFET N-CH 60V 19A/100A 8VSON; Manufacturer: Texas Instruments; Item Type: MOSFETs; Number of Channels: 1NUMBER; Supplier: Mouser; LCSC Part Number: C2683366; Manufacturer Part Number: CSD18531Q5A; RoHS: Yes; Stock: 2842; Pricing: 1=1.48, 10=1.22, 50=1.22, 100=0.944, 1000=0.652, 10000=0.558 (USD); Thickness: 1mm; ComponentLink1URL: https://datasheet.ciiva.com/6386/csd18531q5a-6386406.pdf?src-supplier=Digikey; ComponentLink1Description: https://datasheet.ciiva.com/6386/csd18531q5a-6386406.pdf?src-supplier=Digikey; ComponentLink2URL: https://datasheet.ciiva.com/13063/csd18531q5a-108247-13063440.pdf?src-supplier=Mouser; ComponentLink2Description: https://datasheet.ciiva.com/13063/csd18531q5a-108247-13063440.pdf?src-supplier=Mouser; ComponentLink3URL: https://datasheet.ciiva.com/23868/1762944-23868000.pdf?src-supplier=Newark; ComponentLink3Description: https://datasheet.ciiva.com/23868/1762944-23868000.pdf?src-supplier=Newark; ComponentLink4URL: https://datasheet.ciiva.com/14192/slps321b-14192915.pdf?src-supplier=Avnet; ComponentLink4Description: https://datasheet.ciiva.com/14192/slps321b-14192915.pdf?src-supplier=Avnet; ComponentLink5URL: https://datasheet.ciiva.com/22712/1733500-22712609.pdf?src-supplier=Element14; ComponentLink5Description: https://datasheet.ciiva.com/22712/1733500-22712609.pdf?src-supplier=Element14; ComponentLink6URL: https://datasheet.ciiva.com/6386/csd18531q5a-6386407.pdf?src-supplier=Digikey; ComponentLink6Description: https://datasheet.ciiva.com/6386/csd18531q5a-6386407.pdf?src-supplier=Digikey; ComponentLink7URL: https://datasheet.ciiva.com/6386/csd18531q5a-6386408.pdf?src-supplier=Digikey; ComponentLink7Description: https://datasheet.ciiva.com/6386/csd18531q5a-6386408.pdf?src-supplier=Digikey
Q2 = CSD19537Q3: MOSFET N-CH 100V 9.7A/50A 8VSON; Manufacturer: Texas Instruments; Item Type: MOSFETs; Supplier: Mouser; LCSC Part Number: C478469; Manufacturer Part Number: CSD19537Q3; RoHS: Yes; Stock: 5910; Pricing: 1=1.54, 10=1.02, 50=1.02, 100=0.694, 1000=0.514, 10000=0.439 (USD); ComponentLink1URL: http://www.ti.com/lit/gpn/csd19537q3?src-supplier=Mouser; ComponentLink1Description: http://www.ti.com/lit/gpn/csd19537q3?src-supplier=Mouser; ComponentLink2URL: http://www.ti.com/general/docs/lit/getliterature.tsp?genericPartNumber=CSD19537Q3&&fileType=pdf&src-supplier=Avnet; ComponentLink2Description: http://www.ti.com/general/docs/lit/getliterature.tsp?genericPartNumber=CSD19537Q3&&fileType=pdf&src-supplier=Avnet; ComponentLink3URL: http://www.ti.com/lit/ds/symlink/csd19537q3.pdf?src-supplier=Digikey; ComponentLink3Description: http://www.ti.com/lit/ds/symlink/csd19537q3.pdf?src-supplier=Digikey; ComponentLink4URL: http://www.ti.com/general/docs/suppproductinfo.tsp?distId=10&amp;gotoUrl=http%3A%2F%2Fwww.ti.com%2Flit%2Fgpn%2Fcsd19537q3&src-supplier=Digikey; ComponentLink4Description: http://www.ti.com/general/docs/suppproductinfo.tsp?distId=10&amp;gotoUrl=http%3A%2F%2Fwww.ti.com%2Flit%2Fgpn%2Fcsd19537q3&src-supplier=Digikey
R1 = RT0402BRD07348RL: RES SMD 348 OHM 0.1% 1/16W 0402; Manufacturer: Yageo; Item Type: Resistors; Power Rating: 62.5mW; Voltage Rating: 50V; Temperature Coefficient: 25ppm/°C; Max Power Dissipation: 63mW; Supplier: Digikey; LCSC Part Number: C852731; Manufacturer Part Number: RT0402BRD07348RL; RoHS: Yes; Stock: 32659; Pricing: 1=0.16, 10=0.124, 50=0.098, 100=0.0877, 500=0.0663, 1000=0.05814, 5000=0.04386 (USD); Case/Package: 0402; Case Code (Imperial): 0402; Case Code (Metric): 1005; Weight: 2.3E-05oz; Min Operating Temperature: -55°C; Max Operating Temperature: 155°C; Value: 348R; Packaging: Tape and Reel; Tolerance: 0.1%; Termination: SMD/SMT; Voltage Rating (DC): 50V; Series: RT; Number of Terminations: 2; Length: 1mm; Width: 0.5mm; Height: 0.3mm; Lead Free: Lead Free; RoHS Compliant: Yes; ComponentLink1URL: http://www.mouser.com/ds/2/447/yageodocoutput-1125656.pdf?src-supplier=Mouser; ComponentLink1Description: http://www.mouser.com/ds/2/447/yageodocoutput-1125656.pdf?src-supplier=Mouser; ComponentLink2URL: http://www.yageo.com/documents/recent/PYu-RT_1-to-0.01_RoHS_L_9.pdf?src-supplier=Digikey; ComponentLink2Description: http://www.yageo.com/documents/recent/PYu-RT_1-to-0.01_RoHS_L_9.pdf?src-supplier=Digikey
R2 = RC0402FR-07100RL: RES 100 OHM 1% 1/16W 0402; Manufacturer: Yageo; Power Rating: 62.5mW; Voltage Rating: 50V; Temperature Coefficient: 100ppm/°C; Max Power Dissipation: 63mW; Item Type: Resistor; Supplier 1: Mouser; Manufacturer Part Number: RC0402FR-07100RL; RoHS: Yes; Category: Chip SMD Resistors; Stock 1: 699545; Pricing 1: 1=0.10000, 10=0.01200, 50=0.01200, 100=0.00500, 1000=0.00300, 2500=0.00200, 10000=0.00100 (USD); Case/Package: 0402; Number of Pins: 2; Case Code (Imperial): 0402; Case Code (Metric): 1005; Size Code: 0402; Min Operating Temperature: -55°C; Max Operating Temperature: 155°C; Tolerance: 1%; Voltage Rating (DC): 50V; Resistance: 100R; Packaging: Tape and Reel; Termination: SMD/SMT; Resistor Type: Thick Film; Features: Moisture Resistant; Series: RC; Number of Terminations: 2; Resistance Tolerance: 1%; Construction: Rectangular; Technology: THICK FILM; Length: 1mm; Width: 0.5mm; Height: 0.32mm; Depth: 0.5mm; RoHS Compliant: Yes; REACH SVHC: No SVHC; Military Standard: Not; Lead Free: Lead Free; ComponentLink1URL: https://datasheet.ciiva.com/11808/0900766b80c66297-11808765.pdf?src-supplier=RSComponents; ComponentLink1Description: https://datasheet.ciiva.com/11808/0900766b80c66297-11808765.pdf?src-supplier=RSComponents; ComponentLink2URL: https://datasheet.ciiva.com/7849/1784430-7849810.pdf?src-supplier=Element14; ComponentLink2Description: https://datasheet.ciiva.com/7849/1784430-7849810.pdf?src-supplier=Element14; ComponentLink3URL: https://datasheet.ciiva.com/28367/1018594-28367226.pdf?src-supplier=Element14; ComponentLink3Description: https://datasheet.ciiva.com/28367/1018594-28367226.pdf?src-supplier=Element14; ComponentLink4URL: https://datasheet.ciiva.com/22747/1018594-22747511.pdf?src-supplier=Element14; ComponentLink4Description: https://datasheet.ciiva.com/22747/1018594-22747511.pdf?src-supplier=Element14; ComponentLink5URL: https://datasheet.ciiva.com/12667/pyu-rc0402-51-rohs-l-6-r-12667957.pdf?src-supplier=Mouser; ComponentLink5Description: https://datasheet.ciiva.com/12667/pyu-rc0402-51-rohs-l-6-r-12667957.pdf?src-supplier=Mouser; ComponentLink6URL: https://datasheet.ciiva.com/15189/getdatasheetpartid-329466-15189335.pdf?src-supplier=Verical; ComponentLink6Description: https://datasheet.ciiva.com/15189/getdatasheetpartid-329466-15189335.pdf?src-supplier=Verical; ComponentLink7URL: https://datasheet.ciiva.com/16740/pyu-rc0402-51-rohs-l-6-r-16740566.pdf?src-supplier=Future+Electronics; ComponentLink7Description: https://datasheet.ciiva.com/16740/pyu-rc0402-51-rohs-l-6-r-16740566.pdf?src-supplier=Future+Electronics; Supplier Part Number 1: 603-RC0402FR-07100RL; LCSC Part Number: C106232
R3 = RT0402BRD07120KL: RES SMD 120K OHM 0.1% 1/16W 0402; Manufacturer: Yageo; Item Type: Resistor; Supplier: Future Electronics; Supplier Part Number: 4117142; Manufacturer Part Number: RT0402BRD07120KL; RoHS: Yes; Category: Chip SMD Resistors; Stock: 10000; Pricing: 10000=0.0243, 20000=0.0238, 40000=0.0232, 50000=0.023, 150000=0.022 (USD); ComponentLink1URL: https://datasheet.ciiva.com/12724/pyu-rt-1-to-0-05-rohs-l-4-12724453.pdf?src-supplier=Mouser; ComponentLink1Description: https://datasheet.ciiva.com/12724/pyu-rt-1-to-0-05-rohs-l-4-12724453.pdf?src-supplier=Mouser; LCSC Part Number: C852501
R4 = RT0402BRD07100KL: RES SMD 100K OHM 0.1% 1/16W 0402; Manufacturer: Yageo; Voltage Rating (DC): 50V; Item Type: Resistor; Supplier: Digikey; Supplier Part Number: YAG1343CT-ND; Manufacturer Part Number: RT0402BRD07100KL; RoHS: Yes; Category: Chip SMD Resistors; Stock: 62932; Pricing: 1=0.16, 10=0.121, 50=0.0958, 100=0.0859, 500=0.0654, 1000=0.0578, 5000=0.04283 (USD); ComponentLink1URL: https://datasheet.ciiva.com/12724/pyu-rt-1-to-0-05-rohs-l-4-12724954.pdf?src-supplier=Mouser; ComponentLink1Description: https://datasheet.ciiva.com/12724/pyu-rt-1-to-0-05-rohs-l-4-12724954.pdf?src-supplier=Mouser; LCSC Part Number: C852472
R5 = RC0402FR-073K9L: RES 3.9K OHM 1% 1/16W 0402; Manufacturer: Yageo; Temperature Coefficient: 100ppm/°C; Power Rating: 62.5mW; Value: 3.9kR; Voltage Rating: 50V; Max Power Dissipation: 63mW; Item Type: Resistor; Supplier: Future Electronics; Supplier Part Number: 9808155; Manufacturer Part Number: RC0402FR-073K9L; RoHS: Yes; Category: Chip SMD Resistors; Stock: 6910000; Pricing: 10000=0.0011, 100000=0.0011, 300000=0.001, 750000=0.001, 2000000=0.0009 (USD); Case/Package: 0402; Case Code (Imperial): 0402; Case Code (Metric): 1005; Min Operating Temperature: -55°C; Max Operating Temperature: 155°C; Tolerance: 1%; Packaging: Tape and Reel; Resistor Type: Thick Film; Series: RC; Termination: SMD/SMT; Number of Terminations: 2; Features: Moisture Resistant; Resistance Tolerance: 1%; Construction: Rectangular; Voltage Rating (AC): 50V; Length: 1mm; Depth: 0.5mm; Lead Free: Lead Free; RoHS Compliant: Yes; Reach SVHC Compliant: Unknown; Military Standard: Not; ComponentLink1URL: https://datasheet.ciiva.com/12666/pyu-rc0402-51-rohs-l-6-r-12666997.pdf?src-supplier=Mouser; ComponentLink1Description: https://datasheet.ciiva.com/12666/pyu-rc0402-51-rohs-l-6-r-12666997.pdf?src-supplier=Mouser; ComponentLink2URL: https://datasheet.ciiva.com/7849/1018594-7849989.pdf?src-supplier=Element14; ComponentLink2Description: https://datasheet.ciiva.com/7849/1018594-7849989.pdf?src-supplier=Element14; ComponentLink3URL: https://datasheet.ciiva.com/7849/1018594-7849990.pdf?src-supplier=Element14; ComponentLink3Description: https://datasheet.ciiva.com/7849/1018594-7849990.pdf?src-supplier=Element14; ComponentLink4URL: https://datasheet.ciiva.com/15189/getdatasheetpartid-469246-15189453.pdf?src-supplier=Verical; ComponentLink4Description: https://datasheet.ciiva.com/15189/getdatasheetpartid-469246-15189453.pdf?src-supplier=Verical; LCSC Part Number: C131467
R6 = RC0603FR-0748K7L: RES 48.7K OHM 1% 1/10W 0603; Manufacturer: Yageo; Item Type: Resistor; Voltage Rating (DC): 50V; Supplier: Avnet; Supplier Part Number: 49AK2108; Manufacturer Part Number: RC0603FR-0748K7L; RoHS: Yes; Stock: 2423; Pricing: 1=0.104, 25=0.011, 50=0.009, 100=0.006 (USD); Lead Free: 5697LeadFree; ComponentLink1URL: https://datasheet.ciiva.com/2454/pyu-r-int-thick-7-2454495.pdf?src-supplier=Digikey; ComponentLink1Description: https://datasheet.ciiva.com/2454/pyu-r-int-thick-7-2454495.pdf?src-supplier=Digikey; ComponentLink2URL: https://datasheet.ciiva.com/2454/pyu-r-int-thick-7-2454496.pdf?src-supplier=Digikey; ComponentLink2Description: https://datasheet.ciiva.com/2454/pyu-r-int-thick-7-2454496.pdf?src-supplier=Digikey; ComponentLink3URL: https://datasheet.ciiva.com/2454/pyu-r-int-thick-7-2454497.pdf?src-supplier=Digikey; ComponentLink3Description: https://datasheet.ciiva.com/2454/pyu-r-int-thick-7-2454497.pdf?src-supplier=Digikey
R7 = RC0402FR-072K49L: RES 2.49K OHM 1% 1/16W 0402; Manufacturer: Yageo; Item Type: Resistors; Value: 2.49kR; Temperature Coefficient: 100ppm/°C; Power Rating: 62.5mW; Voltage Rating: 50V; Max Power Dissipation: 63mW; Supplier: Future Electronics; Supplier Part Number: 7635139; Manufacturer Part Number: RC0402FR-072K49L; RoHS: Yes; Stock: 530000; Pricing: 10000=0.0012, 100000=0.0011, 300000=0.001, 750000=0.001, 2000000=0.0009 (USD); Case/Package: 0402; Case Code (Metric): 1005; Case Code (Imperial): 0402; Contact Plating: Tin,Lead; Min Operating Temperature: -55°C; Max Operating Temperature: 155°C; Tolerance: 1%; Resistor Type: Thick Film; Package Quantity: 1; Packaging: Tape and Reel; Number of Terminations: 2; Termination: SMD/SMT; Voltage Rating (DC): 50V; Features: Moisture Resistant; Series: RC; Resistance Tolerance: 1%; Length: 0.039inch; Width: 0.02inch; Height: 0.016inch; Reach SVHC Compliant: No; Lead Free: Lead Free; RoHS Compliant: Yes; ComponentLink1URL: https://datasheet.ciiva.com/2518/pyu-r-int-thick-7-2518986.pdf?src-supplier=Digikey; ComponentLink1Description: https://datasheet.ciiva.com/2518/pyu-r-int-thick-7-2518986.pdf?src-supplier=Digikey; ComponentLink2URL: https://datasheet.ciiva.com/2518/pyu-r-int-thick-7-2518987.pdf?src-supplier=Digikey; ComponentLink2Description: https://datasheet.ciiva.com/2518/pyu-r-int-thick-7-2518987.pdf?src-supplier=Digikey; ComponentLink3URL: https://datasheet.ciiva.com/7983/1018594-7983516.pdf?src-supplier=Element14; ComponentLink3Description: https://datasheet.ciiva.com/7983/1018594-7983516.pdf?src-supplier=Element14; ComponentLink4URL: https://datasheet.ciiva.com/2518/pyu-r-int-thick-7-2518985.pdf?src-supplier=Digikey; ComponentLink4Description: https://datasheet.ciiva.com/2518/pyu-r-int-thick-7-2518985.pdf?src-supplier=Digikey; ComponentLink5URL: https://datasheet.ciiva.com/5558/pyu-rc0402-51-rohs-l-6-r-5558122.pdf?src-supplier=Mouser; ComponentLink5Description: https://datasheet.ciiva.com/5558/pyu-rc0402-51-rohs-l-6-r-5558122.pdf?src-supplier=Mouser; LCSC Part Number: C145071
R8 = RT0402BRD072K94L: RES SMD 2.94KOHM 0.1% 1/16W 0402; Manufacturer: Yageo; Item Type: Resistor; Supplier: Mouser; LCSC Part Number: C852709; Manufacturer Part Number: RT0402BRD072K94L; RoHS: Yes; Stock: 11202; Pricing: 1=0.17, 10=0.125, 50=0.099, 100=0.091, 1000=0.061, 10000=0.038 (USD); ComponentLink1URL: https://datasheet.ciiva.com/2582/pyu-rt-1-to-0-05-rohs-l-5-2582298.pdf?src-supplier=Digikey; ComponentLink1Description: https://datasheet.ciiva.com/2582/pyu-rt-1-to-0-05-rohs-l-5-2582298.pdf?src-supplier=Digikey